# Altium schematic sheet Can.SchDoc
size 420 x 297 mm; SheetNumber: 7; SheetTotal: 8
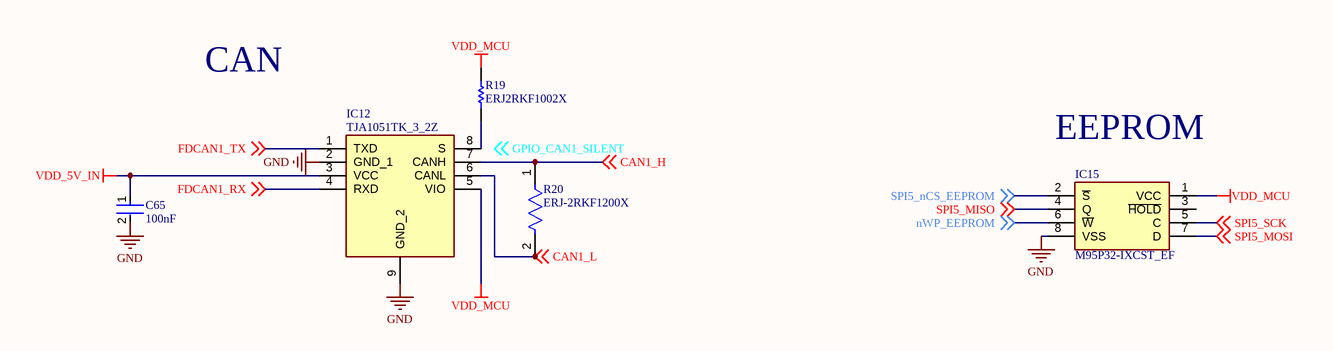
[diagram p0: Can.SchDoc]

## Parts
C65  100nF  [FP-CC0402-MFG]
IC12  TJA1051TK_3_2Z  [SON65P300X300X100-9N-D]
IC15  M95P32-IXCST_EF  [M95P32IXCSTEF]
R19  ERJ2RKF1002X  [RESC1005X40X25LL05T05]
R20  ERJ-2RKF1200X  [FP-ERJ2RK-MFG]

## Nets
GND: C65.2 IC12.2(GND_1) IC12.9(GND_2) IC15.8(VSS)
VDD_5V_IN: C65.1 IC12.3(VCC)
VDD_MCU: IC12.5(VIO) IC15.1(VCC) R19.2
CAN1_H: IC12.7(CANH) R20.1 ; off-sheet CAN1_H
CAN1_L: IC12.6(CANL) R20.2 ; off-sheet CAN1_L
FDCAN1_RX: IC12.4(RXD) ; off-sheet FDCAN1_RX
FDCAN1_TX: IC12.1(TXD) ; off-sheet FDCAN1_TX
nWP_EEPROM: IC15.6(~{W}) ; off-sheet nWP_EEPROM
SPI5_MISO: IC15.4(Q) ; off-sheet SPI5_MISO
SPI5_MOSI: IC15.7(D) ; off-sheet SPI5_MOSI
SPI5_nCS_EEPROM: IC15.2(~{S}) ; off-sheet SPI5_nCS_EEPROM
SPI5_SCK: IC15.5(C) ; off-sheet SPI5_SCK
NetIC12_8: IC12.8(S) R19.1

Not connected (* = marked no-connect by the designer): IC15 3(~{HOLD})

## Notes on the sheet
- CAN
- (near IC15) EEPROM
- Labels drawn without touching a wire or pin: GPIO_CAN1_SILENT
- THIS DOCUMENT AND THE DATA DISCLOSED HEREIN OR
- HEREWITH IS THE PROPERTY OF ALTIUM LIMITED AND MAY
- DWG NO:
- REVISION
- REV:
- DESCRIPTION
- DATE
- APPROVED
- BE FREELY DISTRIBUTED IN WHOLE. NO RIGHTS ARE
- RESERVED OR EXPRESS OR IMPLIED WARANTEE GIVEN.
- ENG:
- APPROVALS
- PROJECT
- DSN:
- CHK:
- REFERENCE DOCUMENTS
- PROJECT REVISION:
- TITLE
- DOCUMENT REVISION:
- DESIGN ITEM:
- BOM:
- FAB DWG:
- PCB DWG:
- ASSY DWG:
- SCALE:
- A3
- SIZE
- CAGE CODE
- FILE NAME
- DWG NO.
- SHEET
- OF
- REV

## Library data of the parts
C65 = CMP-03422-001121-1: CAP CER 0.1UF 16V X7R 0402; Manufacturer: YAGEO; Manufacturer Part Number: CC0402KPX7R7BB104; Material: Ceramic; Temperature Coefficient: 30ppm/°C; Automotive Grade: NA; Tolerance: 0.1; Digikey Description: CAP CER 0.1UF 16V X7R 0402; Temperature Range Low: -55°C; Footprint Url: http://www.yageo.com/exep/pages/download/literatures/UPY-C_GEN_24.pdf; RoHS: TRUE; Device Class L3: Ceramic Capacitors; Temperature Characteristic: X7R; Capacitance: 100 nF; Package: CC0402; Device Class L1: Passive Components; Lead Free: Yes; Temperature Range High: +125°C; Category: Cap; Mouser Description: 0402 0.1 uF 16 V ±10% Tolerance X7R SMT Multilayer Ceramic Capacitor; Voltage Rating: 16 V; Value: 100 nF; ComponentLink2Description: Datasheet; Automotive: No; Octopart: https://octopart.com/cc0402kpx7r7bb104-yageo-21548559; ComponentLink2URL: http://www.yageo.com/documents/recent/UPY-GP_NP0_16V-to-50V_16.pdf; Height: 0.55mm; Device Class L2: Capacitors; Temperature: -55°C to +125°C; Ipc Land Pattern Name: CAPC10050X50
IC12 = TJA1051TK_3: Integrated Circuit; Manufacturer_Name: NXP; Manufacturer_Part_Number: TJA1051TK/3; Datasheet Link: https://www.nxp.com/docs/en/data-sheet/TJA1051.pdf; Height: 1mm; Mouser Part Number: N/A; Mouser Price/Stock: https://www.mouser.co.uk/ProductDetail/NXP-Semiconductors/TJA1051TK-3?qs=fAHHVMwC%252BbjHKozSeK7tBA%3D%3D
IC15 = M95P32-IXCST_EF: Integrated Circuit; Manufacturer_Name: STMicroelectronics; Manufacturer_Part_Number: M95P32-IXCST/EF; Datasheet Link: https://www.st.com/resource/en/datasheet/m95p32-i.pdf; Height: 0.58mm; Mouser Part Number: 511-M95P32-IXCST/EF; Mouser Price/Stock: https://www.mouser.co.uk/ProductDetail/STMicroelectronics/M95P32-IXCST-EF?qs=rQFj71Wb1eVk689cPUP7pg%3D%3D; Arrow Part Number: M95P32-IXCST/EF; Arrow Price/Stock: https://www.arrow.com/en/products/m95p32-ixcstef/stmicroelectronics?utm_currency=USD&region=nac
R19 = CMP-2000-07588-1: Chip Resistor, 10 KOhm, +/- 1%, 0.1 W, -55 to 155 degC, 0402 (1005 Metric), RoHS, Tape and Reel; Manufacturer: Panasonic; Power Rating: 100mW; Voltage Rating: 50V; Resistance: 10KOhm; Case\/Package: 0402; Temperature Coefficient: 100ppm\/degreesC; RoHSCompliant: True; Lead Free: LeadFree; Package Quantity: 1; Contact Plating: Tin; Length: 1mm; Radiation Hardening: No; REACH SVHC: NoSVHC; Max Operating Temperature: 155degC; Depth: 0.5mm; Case Code (Imperial): 0402; Military Standard: Not; Package Description: 2-Pin Surface Mount Device, Body 1 x 0.5 mm; Termination: SMD/SMT; Case Code (Metric): 1005; Height: 0.35mm; Packaging: TapeandReel; Voltage Rating (DC): 50V; Package Reference: 402; Number of Pins: 2; Tolerance: 1%; Mounting Technology: SurfaceMount; Width: 0.02inch; Mount: SurfaceMount; Datasheet URL: https://industrial.panasonic.com/cdbs/www-data/pdf/RDA0000/AOA0000C304.pdf; Composition: ThickFilm; Datasheet Version: 02/2017; Manufacturer URL: http://www.panasonic.com/; Max Power Dissipation: 100mW; Number of Terminations: 2; Min Operating Temperature: -55degC
R20 = CMP-2002-00645-2: RES SMD 120 OHM 1% 1/10W 0402; Resistance: 120R; Voltage Rating (DC): 50V; Temperature Coefficient: 100ppm/°C; Power Rating: 100mW; Case Code (Imperial): 0402; Military Standard: Not; Width: 0.5mm; Technology: THICK FILM; Case Code (Metric): 1005; Lead Free: Lead Free; Radiation Hardening: No; Termination: SMD/SMT; Weight: 0.000388oz; Case/Package: 0402; Resistor Type: Thick Film; Number of Pins: 2; Package Quantity: 10000; Tolerance: 1%; Depth: 0.5mm; RoHS Compliant: Yes; Min Operating Temperature: -55°C; Max Operating Temperature: 155°C; Length: 1mm; Series: ERJ-2Rx; Height: 0.35mm; Mount: Surface Mount; Number of Terminations: 2; Features: Automotive AEC-Q200; Contact Plating: Tin; Voltage Rating: 50V; Max Power Dissipation: 100mW; Packaging: Cut Tape; REACH SVHC: No SVHC